# EAGLE design AquisitionBoard (EAGLE 9.6.0)
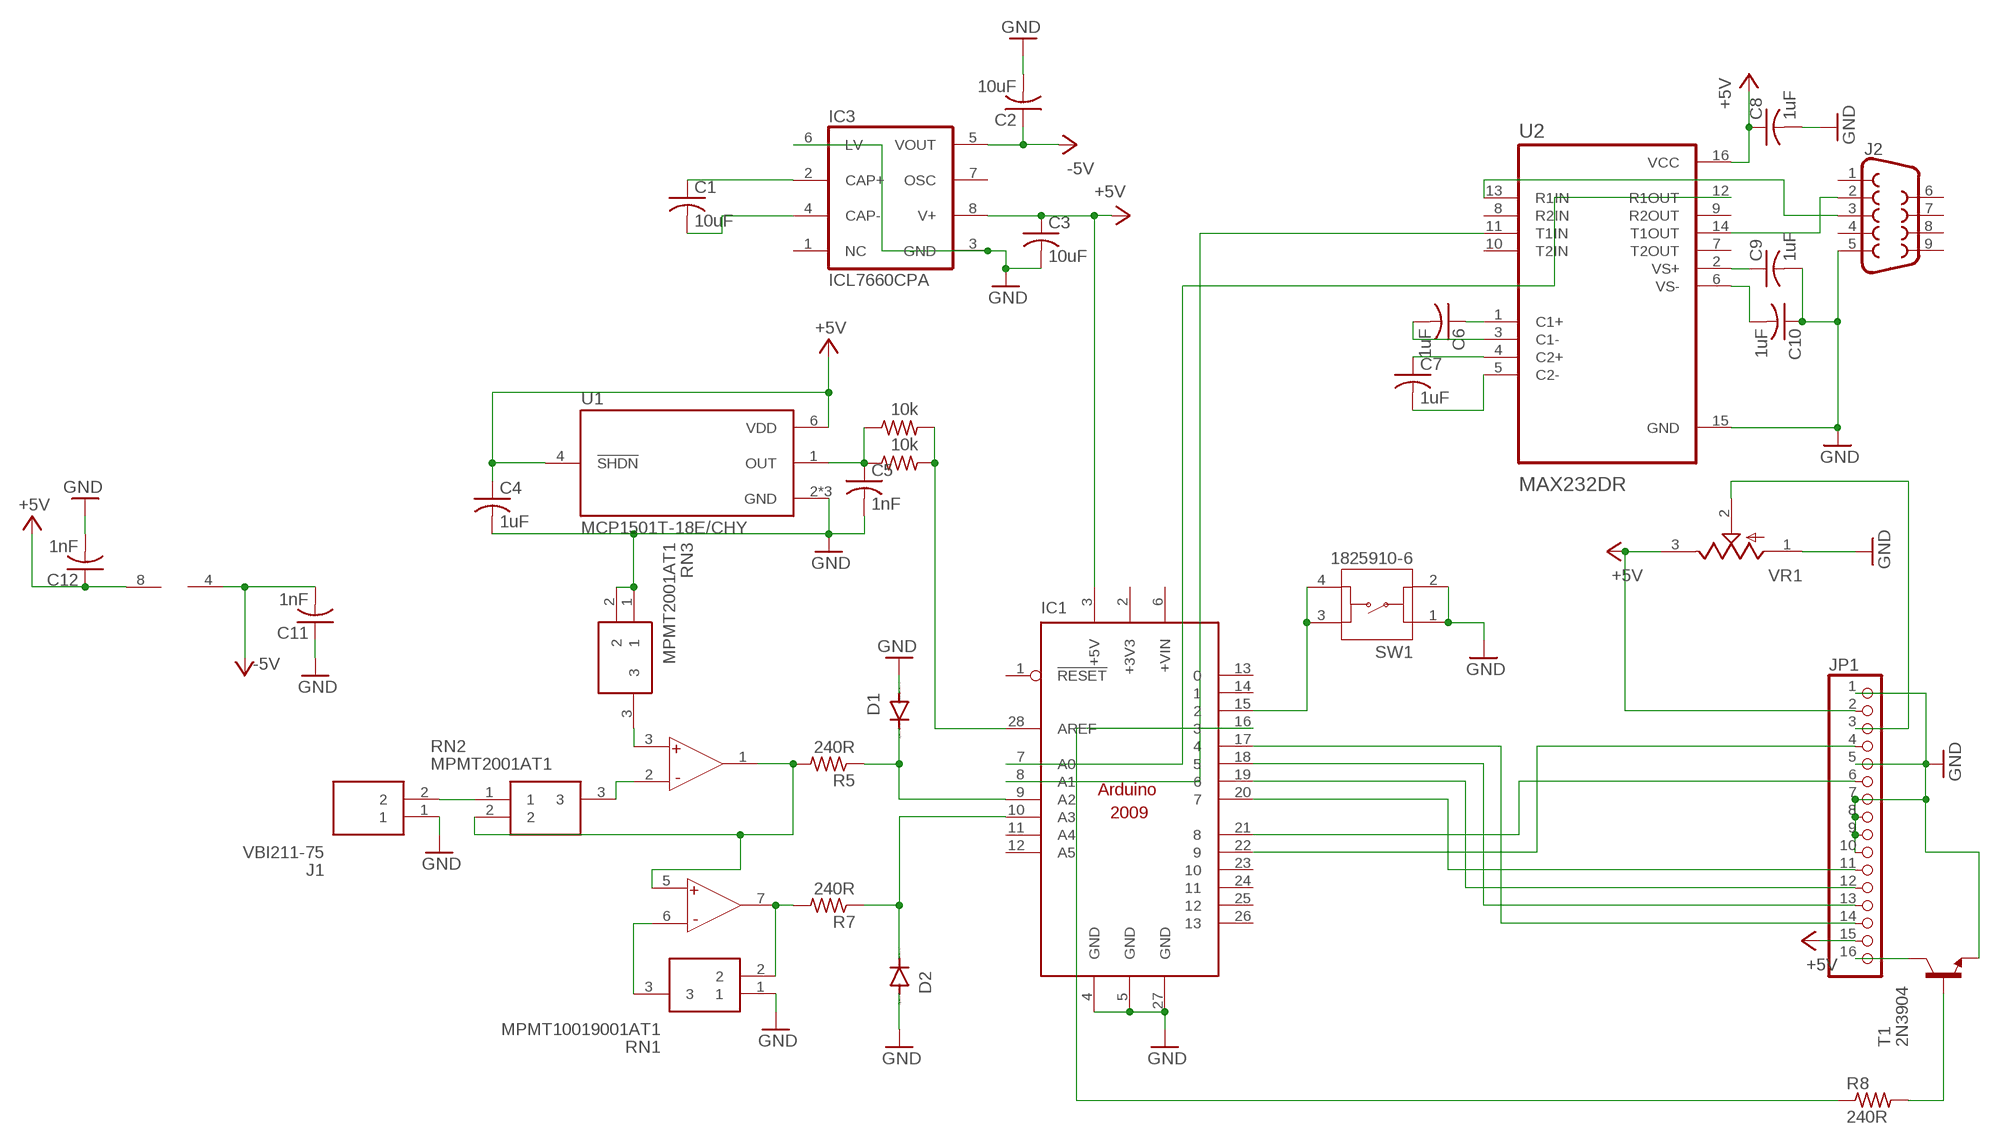
[diagram p0: schematic, sheet 1]

## Parts
C1  10uF  C-USC0603  [C0603]
C2  10uF  C-USC0603  [C0603]
C3  10uF  C-USC0603  [C0603]
C4  1uF  C-USC0603  [C0603]
C5  1nF  C-USC0603  [C0603]
C6  1uF  C-USC0603  [C0603]
C7  1uF  C-USC0603  [C0603]
C8  1uF  C-USC0603  [C0603]
C9  1uF  C-USC0603  [C0603]
C10  1uF  C-USC0603  [C0603]
C11  1nF  C-USC0603  [C0603]
C12  1nF  C-USC0603  [C0603]
D1  1N4148DO35-7  [DO35-7]
D2  1N4148DO35-7  [DO35-7]
IC1  ARDUINO2009_12  [ARDUINO2009_2]
IC3  ICL7660CPA  [DIL08]
J1  VBI211-75  [VBI21175]
J2  DB9MALE  [DB9_MALE]
JP1  PINHD-1X16  [1X16]
R4  10k  R-US_R0805  [R0805]
R5  240R  R-US_R0805  [R0805]
R7  240R  R-US_R0805  [R0805]
R8  240R  R-US_R0805  [R0805]
R9  10k  R-US_R0805  [R0805]
RN1  MPMT10019001AT1  [SOT95P230X102-3N]
RN2  MPMT2001AT1  [SOT95P230X102-3N]
RN3  MPMT2001AT1  [SOT95P230X102-3N]
SW1  1825910-6  [SW_1825910-6-4]
T1  2N3904  [TO92]
U1  MCP1501T-18E/CHY  [SOT95P280X145-6N]
U2  MAX232DR  [SOIC127P600X175-16N]
U$1  OPA2227MOD  [DIP794W53P254L959H508Q8N]
VR1  3362P-1-103LF  [TRIM_3362P-1-103LF]

## Nets
+5V: C3.1 C4.1 C8.1 C12.1 IC1.3(+5V) IC3.8(V+) JP1.2 JP1.15 U1.4(!SHDN) U1.6(VDD) U2.16(VCC) U$1.8(+V) VR1.3(CW)
-5V: C2.1 C11.2 IC3.5(VOUT) U$1.4(-V)
GND: C2.2 C3.2 C4.2 C5.2 C8.2 C9.2 C10.1 C11.1 C12.2 D1.A D2.A IC1.4(GND) IC1.5(GND) IC1.27(GND) IC3.3(GND) IC3.6(LV) J1.1 J2.5 JP1.1 JP1.5 JP1.7 JP1.8 JP1.9 JP1.10 RN1.1 RN3.1 RN3.2 SW1.1 SW1.2 T1.3(E) U1.2(GND) U1.3(GND) U1.5(GND) U2.15(GND) VR1.1(CCW)
N$1: J1.2 RN2.1
N$2: C1.1 IC3.2(CAP+)
N$3: C1.2 IC3.4(CAP-)
N$4: IC1.16 R8.1
N$6: R7.2 RN1.2 U$1.7(OUT)
N$7: R5.2 RN2.2 U$1.1(OUT) U$1.5(NONINVERT)
N$8: D1.C IC1.9(A2) R5.1
N$9: IC1.28(AREF) R4.2 R9.2
N$10: D2.C IC1.10(A3) R7.1
N$11: RN2.3 U$1.2(INVERT)
N$12: IC1.8(A1) U2.11(T1IN)
N$13: IC1.7(A0) U2.12(R1OUT)
N$14: RN1.3 U$1.6(INVERT)
N$15: RN3.3 U$1.3(NONINVERT)
N$17: JP1.3 VR1.2(WIPER)
N$18: IC1.17 JP1.14
N$19: IC1.18 JP1.13
N$20: J2.3 U2.13(R1IN)
N$21: IC1.19 JP1.12
N$22: C5.1 R4.1 R9.1 U1.1(OUT)
N$23: JP1.16 T1.1(C)
N$24: IC1.20 JP1.11
N$25: J2.2 U2.14(T1OUT)
N$26: IC1.22 JP1.4
N$27: IC1.15 SW1.3 SW1.4
N$28: R8.2 T1.2(B)
N$29: C6.1 U2.1(C1+)
N$30: C6.2 U2.3(C1-)
N$31: C7.1 U2.4(C2+)
N$32: C7.2 U2.5(C2-)
N$33: C9.1 U2.2(VS+)
N$34: C10.2 U2.6(VS-)
N$35: IC1.21 JP1.6
Unconnected: IC1.1(!RESET) IC1.6(+VIN) IC1.11(A4) IC1.12(A5) IC1.13 IC1.14 IC1.23 IC1.24 IC1.25 IC1.26 IC3.1(NC) IC3.7(OSC) J2.1 J2.4 J2.6 J2.7 J2.8 J2.9 U2.7(T2OUT) U2.8(R2IN) U2.9(R2OUT) U2.10(T2IN)

## Power pins joined to a net without a drawn wire
+3V3: IC1.2(+3V3)

## Library data of the parts
C1-C12 = rcl:C-US: CAPACITOR, American symbol; SPICEPREFIX: C
D1 D2 = diode:1N4148: DIODE high speed (Philips)
IC1 = arduino:ARDUINO2009_1: The Arduino Duemilanove ("2009") is a microcontroller board based on the ATmega168 or ATmega328. - 14 digital input/output pins (of which 6 can be used as PWM outputs) - 6 analog inputs, a 16 MHz crystal oscillator - USB connection - power jack - ISP header - reset button It contains everything needed to support the microcontroller; simply connect it to a computer with a USB cable or power it with a AC-to-DC adapter or battery to get started http://arduino.cc/en/Main/ArduinoBoardDuemilanove
IC3 = maxim:ICL7660CPA: VOLTAGE CONVERTER; MF: INTERSIL; MPN: ICL7660CPA; OC_FARNELL: 1018170; OC_NEWARK: 06F7441
J1 = VBI211-75:VBI211-75: RF Connectors / Coaxial Connectors BNC R/A PCB Mt Jack Source: Datasheet <https://www.mouser.mx/datasheet/2/643/dr-CCS-VIT-VBI211-75-1308996.pdf>; DESCRIPTION: RF Connectors / Coaxial Connectors BNC R/A PCB Mt Jack; HEIGHT: 13mm; MANUFACTURER_NAME: Cinch Connectivity Solutions; MANUFACTURER_PART_NUMBER: VBI211-75; MOUSER_PART_NUMBER: 530-VBI211-75; MOUSER_PRICE-STOCK: https://www.mouser.co.uk/ProductDetail/Vitelec-Cinch-Connectivity-Solutions/VBI211-75?qs=HAjLtCtd%252Bdatcts%2FKc37yQ%3D%3D
J2 = SparkFun-Connectors:DB9: DB9 Connector Standard DB9 (D-Sub 9) serial connector. Can be used for CAN bus as well as RS485 and RS232. Footprint production proven. Here is the female version connector we sell at SparkFun: 9 Pin Female Serial Connector - PCB Mount <https://www.sparkfun.com/products/429> (PRT-00429) This connector has been used on the following SparkFun products: SparkFun RS232 Shifter - SMD <https://www.sparkfun.com/products/449> (PRT-00449) SparkFun RS232 Shifter SMD (No DB9) <https://www.sparkfun.com/products/8780> (PRT-08780); PROD_ID: CONN-09904
JP1 = pinhead:PINHD-1X16: PIN HEADER
R4 R5 R7-R9 = rcl:R-US_: RESISTOR, American symbol; SPICEPREFIX: R
RN1 = MPMT10019001AT1:MPMT10019001AT1: Resistor Networks & Arrays 1K/9K .1%ABS .05%RATIO Source: Datasheet <https://componentsearchengine.com/Datasheets/1/MPMT10019001AT1.pdf>; DESCRIPTION: Resistor Networks & Arrays 1K/9K .1%ABS .05%RATIO; HEIGHT: 1.02mm; MANUFACTURER_NAME: Vishay; MANUFACTURER_PART_NUMBER: MPMT10019001AT1; MOUSER_PART_NUMBER: 71-MPMT10019001AT1; MOUSER_PRICE-STOCK: https://www.mouser.co.uk/ProductDetail/Vishay-Thin-Film/MPMT10019001AT1?qs=nuXzIS8loXEoXh5tM%2F0xkQ%3D%3D
RN2 RN3 = MPMT2001AT1:MPMT2001AT1: RES NETWORK 2 RES 1K OHM TO236-3 Source: Datasheet <http://www.vishay.com/docs/60001/mpm.pdf>; DESCRIPTION: RES NETWORK 2 RES 1K OHM TO236-3; HEIGHT: 1.02mm; MANUFACTURER_NAME: Vishay; MANUFACTURER_PART_NUMBER: MPMT2001AT1; MOUSER_PART_NUMBER: 71-MPMT2001AT1; MOUSER_PRICE-STOCK: https://www.mouser.co.uk/ProductDetail/Vishay-Thin-Film/MPMT2001AT1?qs=nuXzIS8loXGnDxUn2Usoxg%3D%3D
SW1 = 1825910-6:1825910-6: Switch Tactile OFF (ON) SPST Round Button PC Pins 0.05A 24VDC 100000Cycles 1.57N Thru-Hole Loose; MANUFACTURER: TE CONNECTIVITY; PARTREV: C10; STANDARD: Manufacturer Recommendations
T1 = transistor:2N3904: NPN TRANSISTOR
U1 = MCP1501T-18E_CHY:MCP1501T-18E/CHY; MANUFACTURER: Microchip; MAXIMUM_PACKAGE_HEIGHT: 1.45 mm; PARTREV: E; SNAPEDA_PN: MCP1501T-10E/CHY; STANDARD: IPC 7351B
U2 = MAX232DR:MAX232DR
U$1 = OPA2227P:OPA2227MOD
VR1 = 3362P-1-103LF:3362P-1-103LF: Res Cermet Trimmer 50K Ohm 10% 1/2W 1(Elec)/1(Mech)Turn 2.77mm (6.6 X 6.99 X 4.7mm) Pin Thru-Hole Tube; MF: Bourns; MP: 3362P-1-205LF; PARTREV: 08/26/10; STANDARD: Manufacturer Recommendation

## Board
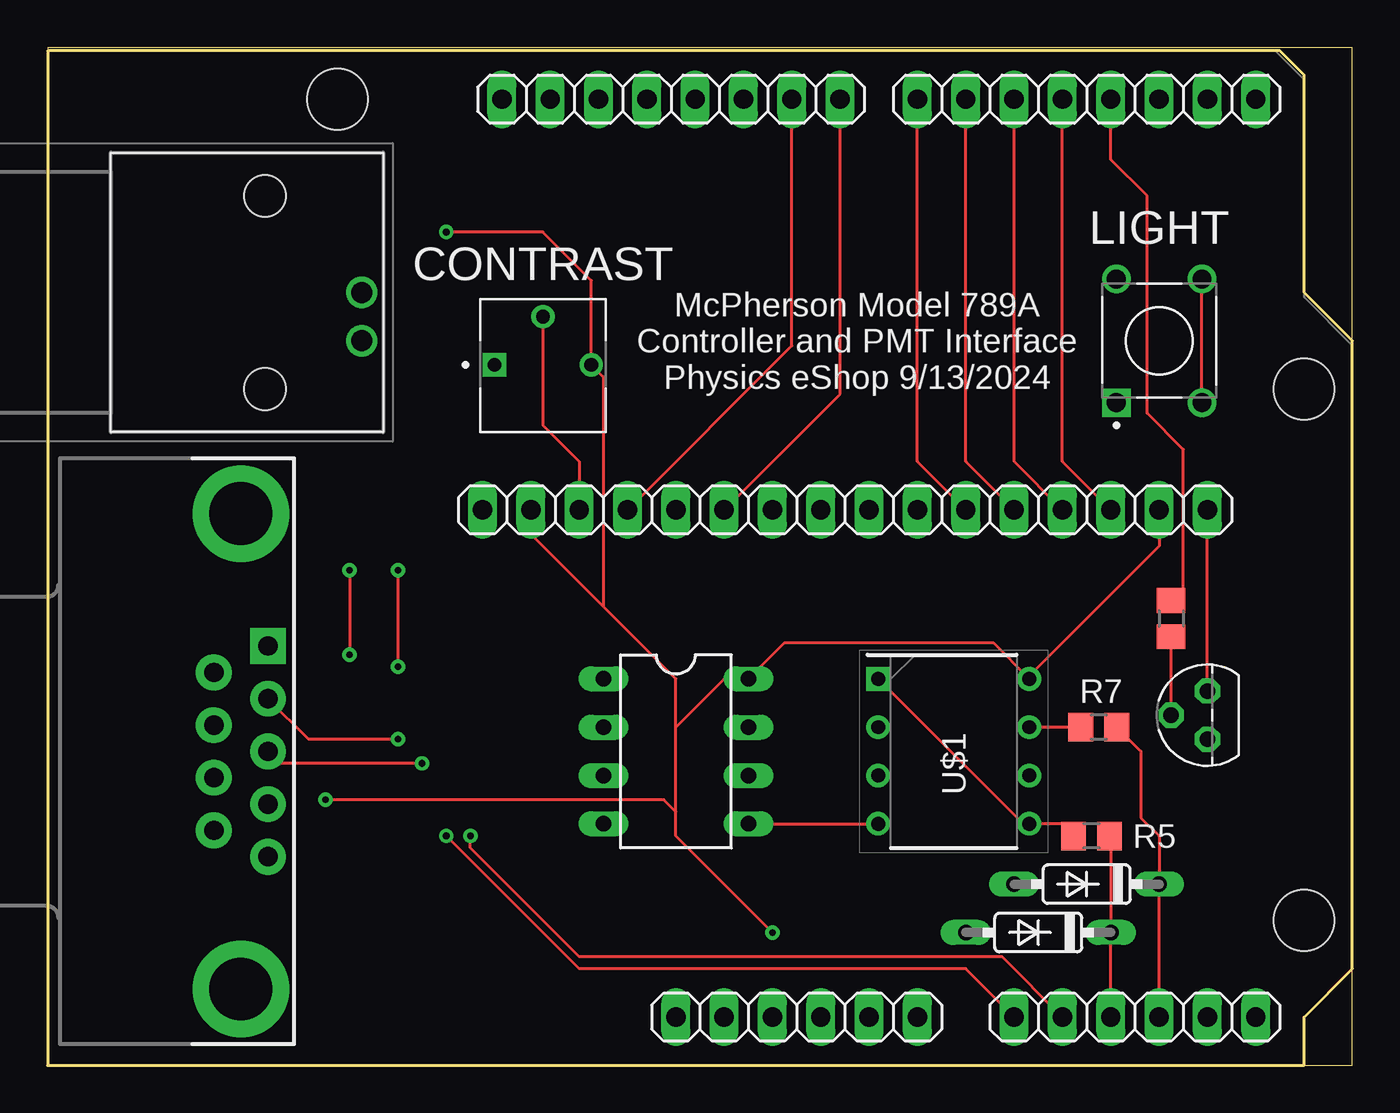
[diagram p1: board, top side]
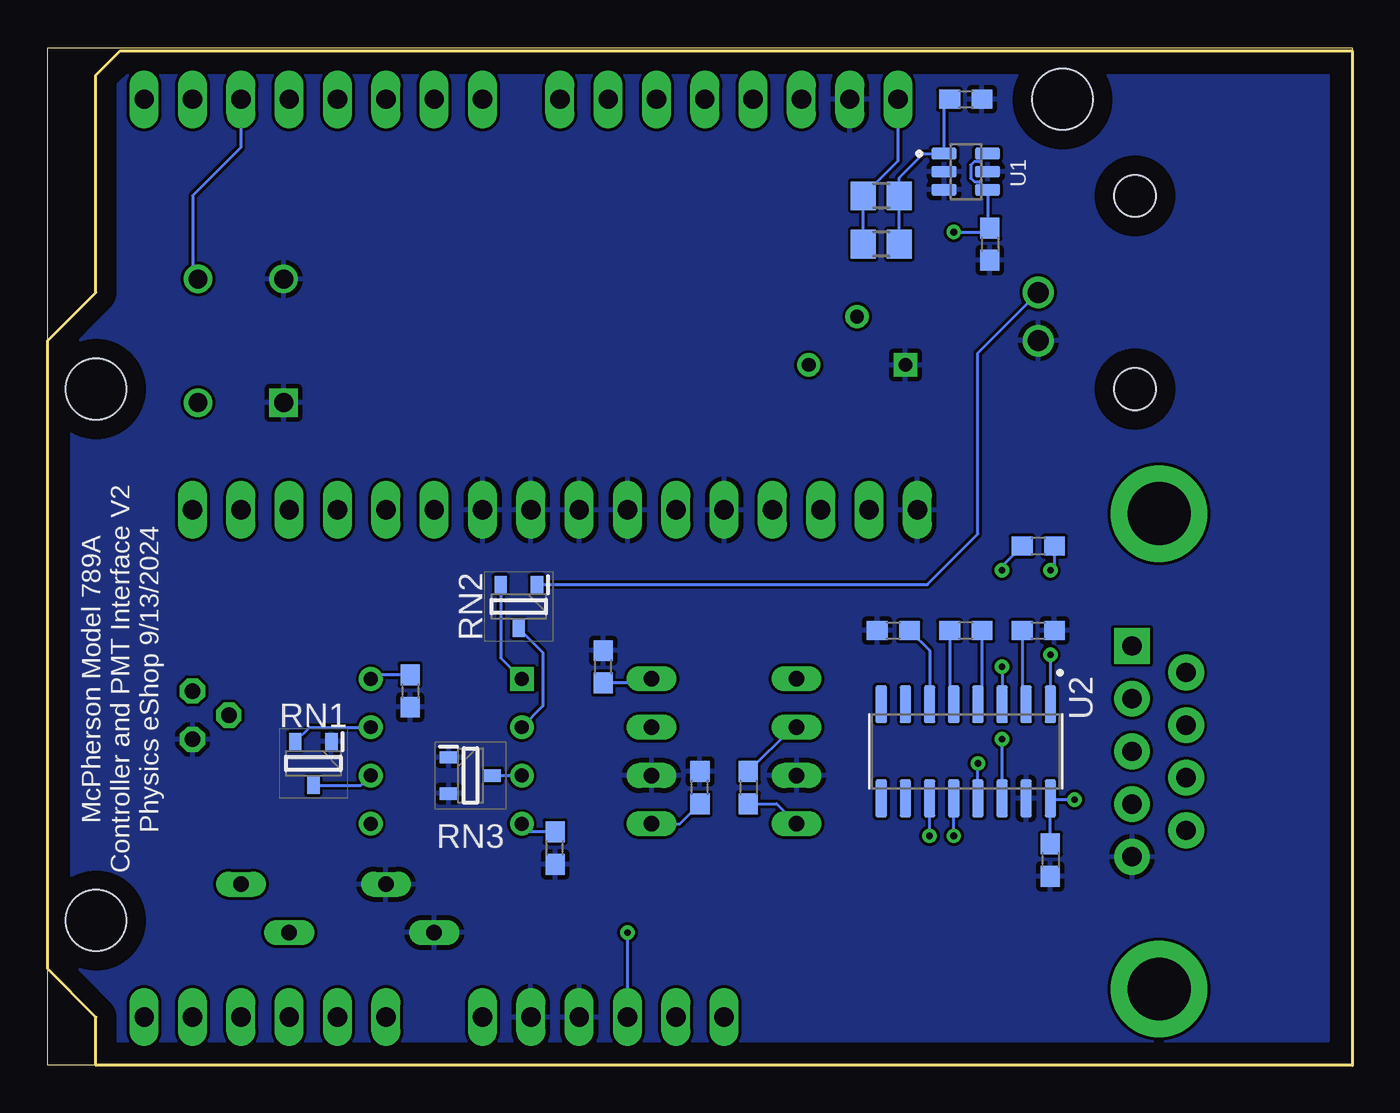
[diagram p2: board, bottom side, seen from below]

Size 68.58 x 53.52 mm. Coordinates in mm from the lower left corner, seen from the top.
Outline: 0,0 68.56,0 68.56,53.52 0,53.52 0,0
Outline: 0,0 66.04,0 66.04,2.54 68.58,5.08 68.58,38.1 66.04,40.64 66.04,52.07 64.77,53.34 0,53.34 0,0
Copper layers (1*16): Top 0.035mm / dielectric 1.5mm / Bottom 0.035mm
Design rules "default": minimum track width 6mil, minimum drill 0.35mm, track to track 6mil, track to pad 6mil, pad to pad 6mil, via to via 6mil, smd to smd 6mil, copper to edge 40mil, drill to drill 6mil, minimum pad ring 10mil, minimum via ring 8mil, stop-mask expansion 4mil, vias tented up to drill 0mil, thermal gap 10mil

### Footprints (pad centres in the part's own frame; a part is rotated, then mirrored left to right if it is on the bottom)
C0603 = smd 1.1 x 1: 1 -0.85,0; 2 0.85,0
DO35-7 = drill 0.813 long: A 3.81,0; C -3.81,0
ARDUINO2009_2 = drill 1.016 long: 1 33.02,2.54; 2 35.56,2.54; 3 38.1,2.54; 4 40.64,2.54; 5 43.18,2.54; 6 45.72,2.54; 7 50.8,2.54; 8 53.34,2.54; 9 55.88,2.54; 10 58.42,2.54; 11 60.96,2.54; 12 63.5,2.54; 13 63.5,50.8; 14 60.96,50.8; 15 58.42,50.8; 16 55.88,50.8; 17 53.34,50.8; 18 50.8,50.8; 19 48.26,50.8; 20 45.72,50.8; 21 41.656,50.8; 22 39.116,50.8; 23 36.576,50.8; 24 34.036,50.8; 25 31.496,50.8; 26 28.956,50.8; 27 26.416,50.8; 28 23.876,50.8 | hole 3.2: 15.24,50.8; 66.04,35.56; 66.04,7.62
DIL08 = drill 0.813 long: 1 -3.81,-3.81; 2 -1.27,-3.81; 3 1.27,-3.81; 4 3.81,-3.81; 5 3.81,3.81; 6 1.27,3.81; 7 -1.27,3.81; 8 -3.81,3.81
VBI21175 = drill 1.1 pad 1.65: 1 0,0; 2 2.54,0 | hole 2.2: -2.54,5.08; 7.62,5.08
DB9_MALE = drill 1.016 pad 1.88 square: 1 5.54,-1.42 | drill 1.016 pad 1.88: 2 2.77,-1.42; 3 0,-1.42; 4 -2.77,-1.42; 5 -5.54,-1.42; 6 4.15,1.42; 7 1.38,1.42; 8 -1.38,1.42; 9 -4.15,1.42 | drill 3.302 pad 5.08: G1 -12.5,0; G2 12.5,0
1X16 = drill 1.016 long: 1 -19.05,0; 2 -16.51,0; 3 -13.97,0; 4 -11.43,0; 5 -8.89,0; 6 -6.35,0; 7 -3.81,0; 8 -1.27,0; 9 1.27,0; 10 3.81,0; 11 6.35,0; 12 8.89,0; 13 11.43,0; 14 13.97,0; 15 16.51,0; 16 19.05,0
R0805 = smd 1.3 x 1.5: 1 -0.95,0; 2 0.95,0
SOT95P230X102-3N = smd 0.9 x 0.65: 1 -1.15,0.95; 2 -1.15,-0.95; 3 1.15,0
SW_1825910-6-4 = drill 0.99 square: 1 -3.25,2.25 | drill 0.99: 2 3.25,2.25; 3 -3.25,-2.25; 4 3.25,-2.25
TO92 = drill 0.813 octagon: 1 1.27,0; 2 0,1.905; 3 -1.27,0
SOT95P280X145-6N = smd 1.32 x 0.59: 1 -1.145,0.95; 2 -1.145,0; 3 -1.145,-0.95; 4 1.145,-0.95; 5 1.145,0; 6 1.145,0.95
SOIC127P600X175-16N = smd 1.97 x 0.6: 1 -2.475,4.445; 2 -2.475,3.175; 3 -2.475,1.905; 4 -2.475,0.635; 5 -2.475,-0.635; 6 -2.475,-1.905; 7 -2.475,-3.175; 8 -2.475,-4.445; 9 2.475,-4.445; 10 2.475,-3.175; 11 2.475,-1.905; 12 2.475,-0.635; 13 2.475,0.635; 14 2.475,1.905; 15 2.475,3.175; 16 2.475,4.445
DIP794W53P254L959H508Q8N = drill 0.73 pad 1.13 square: 1 -3.97,3.81 | drill 0.73 pad 1.13: 2 -3.97,1.27; 3 -3.97,-1.27; 4 -3.97,-3.81; 5 3.97,-3.81; 6 3.97,-1.27; 7 3.97,1.27; 8 3.97,3.81
TRIM_3362P-1-103LF = drill 0.714 square: 1 -2.54,0 | drill 0.714: 2 0,2.54; 3 2.54,0

### Placement (x,y rotation side)
C1  31.75,14.61 270 bottom
C2  34.29,14.61 90 bottom
C3  39.37,20.95 90 bottom
C4  19.05,43.18 270 bottom
C5  20.32,50.8 0 bottom
C6  16.51,27.3 180 bottom
C7  20.32,22.86 180 bottom
C8  15.88,10.79 270 bottom
C9  16.51,22.86 0 bottom
C10  24.13,22.86 0 bottom
C11  41.91,11.43 90 bottom
C12  49.53,19.68 270 bottom
D1  52.07,6.99 180 top
D2  54.61,9.53 180 top
IC1  0,0 0 top
IC3  33.02,16.51 270 top
J1  16.51,38.1 90 top
J2  10.16,16.51 90 top
JP1  41.91,29.21 0 top
R4  24.77,45.72 180 bottom
R5  54.86,12.06 180 top
R7  55.24,17.78 180 top
R8  59.05,23.5 270 top
R9  24.77,43.18 180 bottom
RN1  54.61,15.88 270 bottom
RN2  43.81,24.13 270 bottom
RN3  46.35,15.24 0 bottom
SW1  58.42,38.1 90 top
T1  60.96,18.41 90 top
U1  20.32,46.99 0 bottom
U2  20.32,16.51 270 bottom
U$1  47.62,16.51 0 top
VR1  26.04,36.83 0 top

### Tracks (layer width: path | path; a pad name or v marks a point on that pad's centre or on a via)
+5V  (via drill 0.35)
  Top 0.152: v38.1,6.99 33.02,12.06 33.02,13.34 | 33.02,13.34 33.02,17.78 | 33.02,17.78 35.56,20.32 IC3.8 38.73,22.23 49.69,22.23 51.52,20.4 | 33.02,17.78 33.02,20.32 29.21,24.13 | 29.21,24.13 25.4,27.94 JP1.2 | 33.02,13.34 32.38,13.97 v14.61,13.97 | 29.21,24.13 29.21,36.2 VR1.3 28.57,41.27 26.04,43.81 v20.95,43.81 | 51.52,20.4 U$1.8 | JP1.15 58.42,27.3 51.52,20.4
  Bottom 0.152: U1.6 19.6,47.51 19.89,47.51 20.06,47.34 20.06,46.64 19.89,46.47 19.6,46.47 U1.4 19.18,44.16 C4.1 19.27,43.81 v20.95,43.81 | C8.1 15.88,13.97 | 15.88,13.97 U2.16 | IC1.3 v38.1,6.99 | C3.1 37.05,20.11 IC3.8 | v14.61,13.97 15.88,13.97 | C12.1 51.38,20.54 U$1.8
-5V
  Top 0.152: IC3.5 U$1.4
  Bottom 0.152: IC3.5 35.34,12.7 C2.1 | C11.2 43.23,12.28 U$1.4
GND
  pour Bottom: 1.27,1.27 67.31,1.27 67.31,52.07 1.27,52.07
N$1
  Bottom 0.152: RN2.1 22.34,25.28 19.68,27.94 19.68,37.47 J1.2
N$2
  Bottom 0.152: C1.1 29.43,17.78 IC3.2
N$3
  Bottom 0.152: C1.2 30.27,13.76 IC3.4
N$4
  Top 0.152: R8.1 59.69,25.08 59.69,32.38 57.78,34.29 57.78,45.72 55.88,47.62 IC1.16
N$6
  Top 0.152: R7.2 U$1.7
  Bottom 0.152: RN1.2 54.8,17.78 U$1.7
N$7
  Top 0.152: R5.2 53.28,12.7 U$1.5 51.27,12.7 U$1.1
  Bottom 0.152: RN2.2 44.77,21.43 U$1.1
N$8
  Top 0.152: IC1.9 D1.C 55.88,12 R5.1
N$9
  Bottom 0.152: IC1.28 23.88,47.56 R4.2 R9.2
N$10
  Top 0.152: IC1.10 D2.C 58.42,12.06 57.47,13.02 57.47,16.51 R7.1
N$11
  Bottom 0.152: RN2.3 42.55,21.71 42.55,18.89 U$1.2
N$12  (via drill 0.35)
  Top 0.152: IC1.8 50.16,5.71 27.94,5.71 22.23,11.43 v22.23,12.06
  Bottom 0.152: v22.23,12.06 U2.11
N$13  (via drill 0.35)
  Top 0.152: IC1.7 48.26,5.08 27.94,5.08 v20.95,12.06
  Bottom 0.152: v20.95,12.06 U2.12
N$14
  Bottom 0.152: RN1.3 52.11,14.72 U$1.6
N$15
  Bottom 0.152: RN3.3 U$1.3
N$17
  Top 0.152: VR1.2 26.04,33.66 27.94,31.75 JP1.3
N$18
  Top 0.152: JP1.14 53.34,31.75 IC1.17
N$19
  Top 0.152: JP1.13 50.8,31.75 IC1.18
N$20  (via drill 0.35)
  Top 0.152: v19.68,15.88 12.21,15.88 J2.3
  Bottom 0.152: U2.13 v19.68,15.88
N$21
  Top 0.152: JP1.12 48.26,31.75 IC1.19
N$22
  Bottom 0.152: R9.1 R4.1 23.82,46.67 22.55,47.94 U1.1 21.46,50.51 C5.1
N$23
  Top 0.152: T1.1 JP1.16
N$24
  Top 0.152: JP1.11 45.72,31.75 IC1.20
N$25  (via drill 0.35)
  Top 0.152: v18.41,17.14 13.71,17.14 J2.2
  Bottom 0.152: U2.14 v18.41,17.14
N$26
  Top 0.152: JP1.4 39.12,37.85 IC1.22
N$27
  Top 0.152: SW1.3 SW1.4
  Bottom 0.152: IC1.15 58.42,48.26 60.96,45.72 60.96,41.64 SW1.4
N$28
  Top 0.152: T1.2 R8.2
N$29  (via drill 0.35)
  Top 0.152: v15.88,26.04 v15.88,21.59
  Bottom 0.152: C6.1 15.66,26.25 v15.88,26.04 | v15.88,21.59 U2.1
N$30  (via drill 0.35)
  Top 0.152: v18.41,26.04 v18.41,20.95
  Bottom 0.152: C6.2 18.41,26.25 v18.41,26.04 | v18.41,20.95 U2.3
N$31
  Bottom 0.152: C7.1 19.47,19.2 U2.4
N$32
  Bottom 0.152: C7.2 21.17,19.2 U2.5
N$33
  Bottom 0.152: C9.1 17.36,19.2 U2.2
N$34
  Bottom 0.152: C10.2 22.23,21.8 U2.6
N$35
  Top 0.152: JP1.6 41.66,35.31 IC1.21

### Text on the board
tPlace: LIGHT | CONTRAST | McPherson Model 789A / Controller and PMT Interface / Physics eShop 9/13/2024
bPlace: McPherson Model 789A / Controller and PMT Interface V2 / Physics eShop 9/13/2024